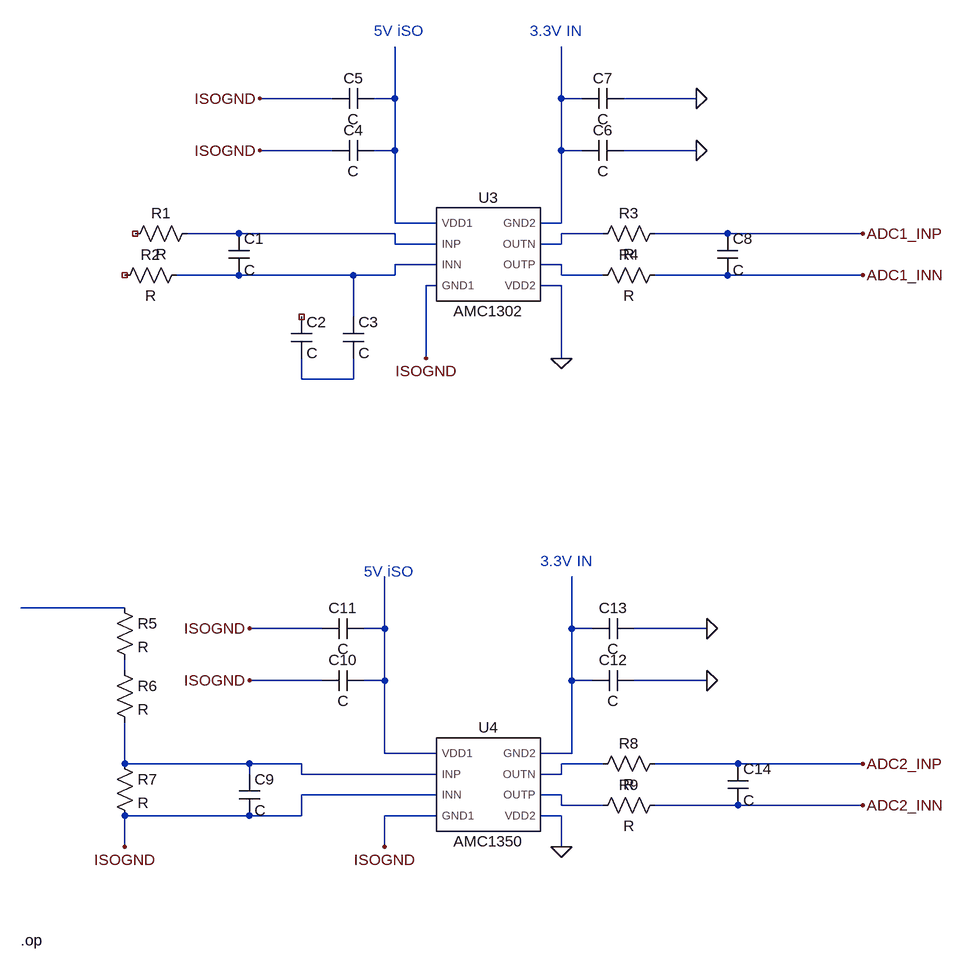
[diagram p0: schematic Hamza_LTSpice.asc]
Hamza_LTSpice.asc, the LTspice schematic file:
Version 4.1
SHEET 1 1244 1264
WIRE 288 -48 176 -48
WIRE 384 -48 384 -128
WIRE 384 -48 352 -48
WIRE 640 -48 640 -128
WIRE 672 -48 640 -48
WIRE 848 -48 736 -48
WIRE 288 32 176 32
WIRE 384 32 384 -48
WIRE 384 32 352 32
WIRE 640 32 640 -48
WIRE 672 32 640 32
WIRE 848 32 736 32
WIRE 384 144 384 32
WIRE 448 144 384 144
WIRE 640 144 640 32
WIRE 640 144 608 144
WIRE 144 160 64 160
WIRE 384 160 144 160
WIRE 704 160 640 160
WIRE 896 160 784 160
WIRE 1104 160 896 160
WIRE 384 176 384 160
WIRE 448 176 384 176
WIRE 640 176 640 160
WIRE 640 176 608 176
WIRE 448 208 384 208
WIRE 640 208 608 208
WIRE 144 224 48 224
WIRE 320 224 144 224
WIRE 384 224 384 208
WIRE 384 224 320 224
WIRE 640 224 640 208
WIRE 704 224 640 224
WIRE 896 224 784 224
WIRE 1104 224 896 224
WIRE 448 240 432 240
WIRE 640 240 608 240
WIRE 320 288 320 224
WIRE 432 352 432 240
WIRE 640 352 640 240
WIRE 240 384 240 352
WIRE 320 384 320 352
WIRE 320 384 240 384
WIRE -32 736 -192 736
WIRE 272 768 160 768
WIRE 368 768 368 688
WIRE 368 768 336 768
WIRE 656 768 656 688
WIRE 688 768 656 768
WIRE 864 768 752 768
WIRE -32 832 -32 816
WIRE 272 848 160 848
WIRE 368 848 368 768
WIRE 368 848 336 848
WIRE 656 848 656 768
WIRE 688 848 656 848
WIRE 864 848 752 848
WIRE 368 960 368 848
WIRE 448 960 368 960
WIRE 656 960 656 848
WIRE 656 960 608 960
WIRE -32 976 -32 912
WIRE 160 976 -32 976
WIRE 240 976 160 976
WIRE 704 976 640 976
WIRE 912 976 784 976
WIRE 1104 976 912 976
WIRE 160 992 160 976
WIRE 240 992 240 976
WIRE 448 992 240 992
WIRE 640 992 640 976
WIRE 640 992 608 992
WIRE 448 1024 240 1024
WIRE 640 1024 608 1024
WIRE 640 1040 640 1024
WIRE 704 1040 640 1040
WIRE 912 1040 784 1040
WIRE 1104 1040 912 1040
WIRE 160 1056 -32 1056
WIRE 240 1056 240 1024
WIRE 240 1056 160 1056
WIRE 448 1056 368 1056
WIRE 640 1056 608 1056
WIRE -32 1104 -32 1056
WIRE 368 1104 368 1056
WIRE 640 1104 640 1056
FLAG 176 -48 ISOGND
FLAG 176 32 ISOGND
FLAG 432 352 ISOGND
FLAG -32 1104 ISOGND
FLAG 160 768 ISOGND
FLAG 160 848 ISOGND
FLAG 368 1104 ISOGND
FLAG 640 1104 0
FLAG 848 -48 0
FLAG 848 32 0
FLAG 640 352 0
FLAG 864 768 0
FLAG 864 848 0
FLAG 1104 160 ADC1_INP
FLAG 1104 224 ADC1_INN
FLAG 1104 976 ADC2_INP
FLAG 1104 1040 ADC2_INN
SYMBOL res 80 144 R90
WINDOW 0 0 56 VBottom 2
WINDOW 3 32 56 VTop 2
SYMATTR InstName R1
SYMBOL res 64 208 R90
WINDOW 0 0 56 VBottom 2
WINDOW 3 32 56 VTop 2
SYMATTR InstName R2
SYMBOL cap 128 160 R0
SYMATTR InstName C1
SYMBOL cap 224 288 R0
SYMATTR InstName C2
SYMBOL cap 304 288 R0
SYMATTR InstName C3
SYMBOL cap 352 16 R90
WINDOW 0 0 32 VBottom 2
WINDOW 3 32 32 VTop 2
SYMATTR InstName C4
SYMBOL cap 352 -64 R90
WINDOW 0 0 32 VBottom 2
WINDOW 3 32 32 VTop 2
SYMATTR InstName C5
SYMBOL cap 672 16 M90
WINDOW 0 0 32 VBottom 2
WINDOW 3 32 32 VTop 2
SYMATTR InstName C6
SYMBOL cap 672 -64 M90
WINDOW 0 0 32 VBottom 2
WINDOW 3 32 32 VTop 2
SYMATTR InstName C7
SYMBOL res 800 208 R90
WINDOW 0 0 56 VBottom 2
WINDOW 3 32 56 VTop 2
SYMATTR InstName R4
SYMBOL res 800 144 R90
WINDOW 0 0 56 VBottom 2
WINDOW 3 32 56 VTop 2
SYMATTR InstName R3
SYMBOL cap 880 160 R0
SYMATTR InstName C8
SYMBOL res -48 720 R0
SYMATTR InstName R5
SYMBOL res -48 816 R0
SYMATTR InstName R6
SYMBOL res -48 960 R0
SYMATTR InstName R7
SYMBOL cap 144 992 R0
SYMATTR InstName C9
SYMBOL cap 336 832 R90
WINDOW 0 0 32 VBottom 2
WINDOW 3 32 32 VTop 2
SYMATTR InstName C10
SYMBOL cap 336 752 R90
WINDOW 0 0 32 VBottom 2
WINDOW 3 32 32 VTop 2
SYMATTR InstName C11
SYMBOL cap 688 832 M90
WINDOW 0 0 32 VBottom 2
WINDOW 3 32 32 VTop 2
SYMATTR InstName C12
SYMBOL cap 688 752 M90
WINDOW 0 0 32 VBottom 2
WINDOW 3 32 32 VTop 2
SYMATTR InstName C13
SYMBOL res 800 960 R90
WINDOW 0 0 56 VBottom 2
WINDOW 3 32 56 VTop 2
SYMATTR InstName R8
SYMBOL res 800 1024 R90
WINDOW 0 0 56 VBottom 2
WINDOW 3 32 56 VTop 2
SYMATTR InstName R9
SYMBOL cap 896 976 R0
SYMATTR InstName C14
SYMBOL AMC1302 528 192 R0
SYMATTR InstName U3
SYMBOL AMC1350 528 1008 R0
SYMATTR InstName U4
TEXT 352 -152 Left 2 ;5V iSO
TEXT 672 -152 Right 2 ;3.3V IN
TEXT 336 680 Left 2 ;5V iSO
TEXT 688 664 Right 2 ;3.3V IN
TEXT -192 1248 Left 2 !.op

The netlist it stands for:
* Hamza_LTSpice.asc
R1 N003 NC_01 R
R2 N005 NC_02 R
C1 N003 N005 C
C2 NC_03 N007 C
C3 N005 N007 C
C4 N001 ISOGND C
C5 N001 ISOGND C
C6 N002 0 C
C7 N002 0 C
R4 ADC1_INN N006 R
R3 ADC1_INP N004 R
C8 ADC1_INP ADC1_INN C
R5 N008 N011 R
R6 N011 N012 R
R7 N012 ISOGND R
C9 N012 ISOGND C
C10 N009 ISOGND C
C11 N009 ISOGND C
C12 N010 0 C
C13 N010 0 C
R8 ADC2_INP N013 R
R9 ADC2_INN N014 R
C14 ADC2_INP ADC2_INN C
X§U3 N001 N003 N005 ISOGND N002 N004 N006 0 AMC1302  ; pins VDD1 INP INN GND1 GND2 OUTN OUTP VDD2
X§U4 N009 N012 ISOGND ISOGND N010 N013 N014 0 AMC1350  ; pins VDD1 INP INN GND1 GND2 OUTN OUTP VDD2
* 5V iSO
* 3.3V IN
* 5V iSO
* 3.3V IN
.op
.lib Amc1302.lib
.lib AMC1350.lib
.backanno
.end